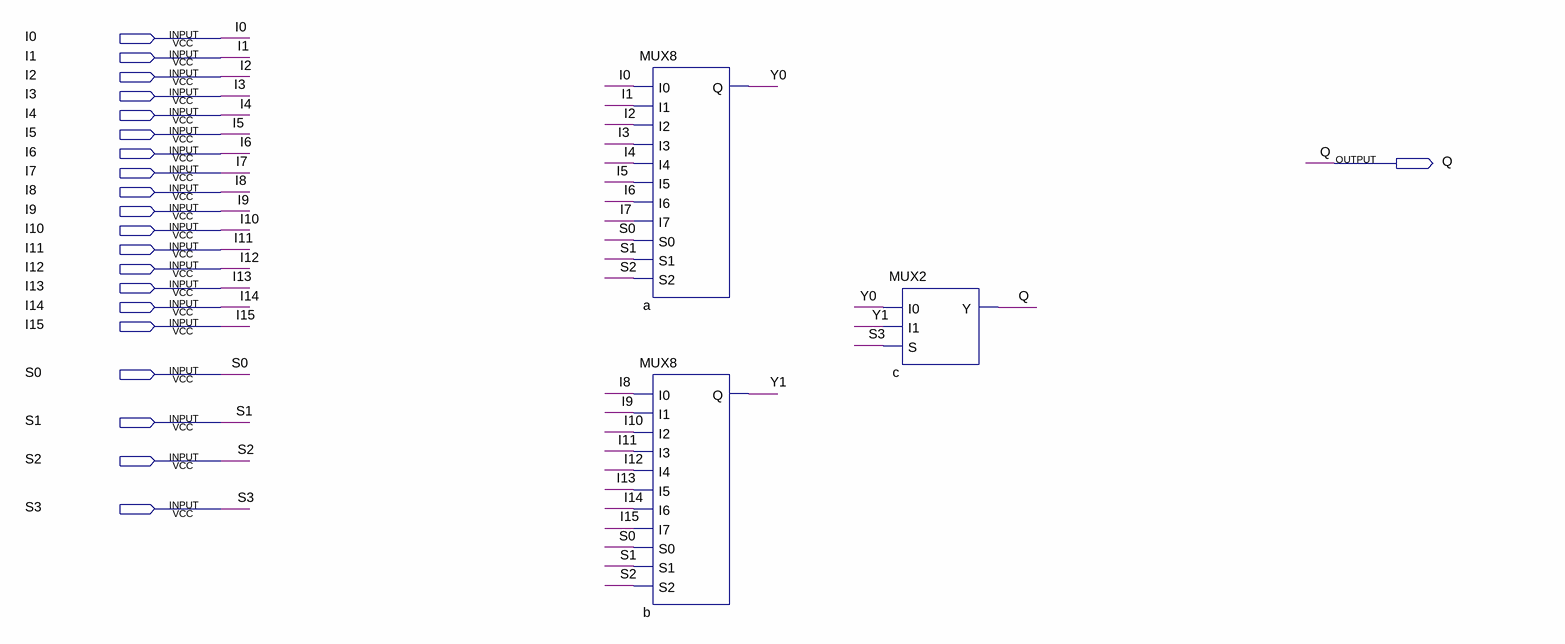
[diagram p0: schematic sheet]
// Quartus schematic MUX16.bdf as structural Verilog: 3 symbols, 21 pins
module MUX16 (
  input  I0,
  input  I1,
  input  I2,
  input  I3,
  input  I4,
  input  I5,
  input  I6,
  input  I7,
  input  I8,
  input  I9,
  input  I10,
  input  I11,
  input  I12,
  input  I13,
  input  I14,
  input  I15,
  input  S0,
  input  S1,
  input  S2,
  input  S3,
  output Q
);

  wire Y0, Y1;

  MUX8 a (.I0(I0), .I1(I1), .I2(I2), .I3(I3), .I4(I4), .I5(I5), .I6(I6), .I7(I7), .S0(S0), .S1(S1), .S2(S2), .Q(Y0));
  MUX8 b (
    .I0(I8), .I1(I9), .I2(I10), .I3(I11), .I4(I12), .I5(I13), .I6(I14), .I7(I15), .S0(S0), .S1(S1), .S2(S2),
    .Q(Y1));
  MUX2 c (.I0(Y0), .I1(Y1), .S(S3), .Y(Q));
endmodule
